# Altium schematic sheet Spider Remote.SchDoc
size A4; SheetNumber: 1; SheetTotal: 1
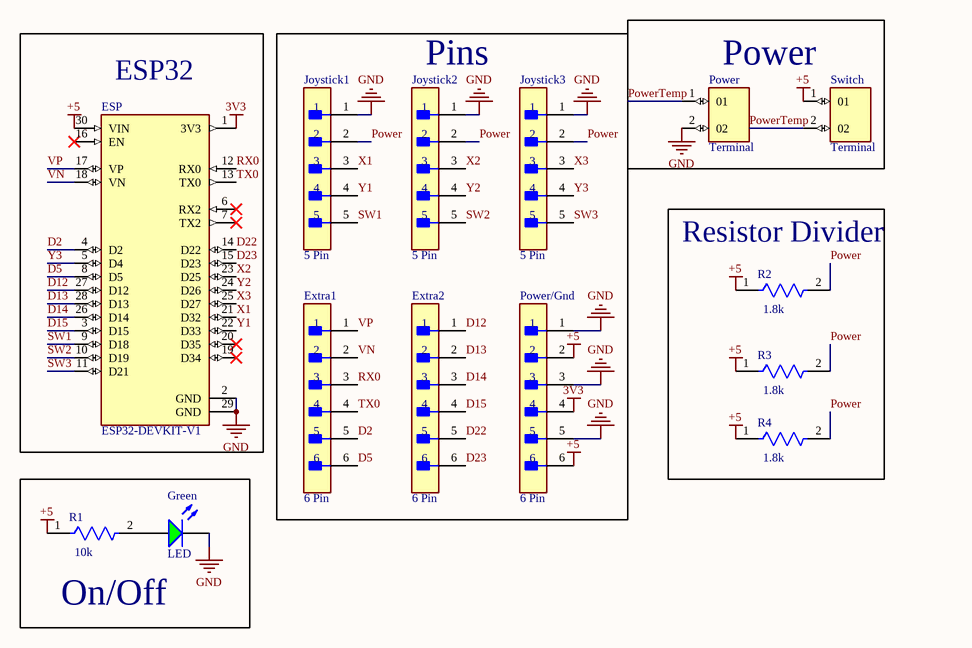
[diagram p0: Spider Remote.SchDoc]

## Parts
ESP  ESP32-DEVKIT-V1  [MODULE_ESP32_DEVKIT_V1]
Extra1  6 Pin  [FP-22-28-4063-MFG]
Extra2  6 Pin  [FP-22-28-4063-MFG]
Green  LED  [KING-WP7113SGD_V]
Joystick1  5 Pin  [FP-90120-0125-MFG]
Joystick2  5 Pin  [FP-90120-0125-MFG]
Joystick3  5 Pin  [FP-90120-0125-MFG]
Power  Terminal  [EBBA-02-C-SS-BU]
Power/Gnd  6 Pin  [FP-22-28-4063-MFG]
R1  10k  [FP-MBB0207-MFG]
R2  1.8k  [FP-MBB0207-MFG]
R3  1.8k  [FP-MBB0207-MFG]
R4  1.8k  [FP-MBB0207-MFG]
Switch  Terminal  [EBBA-02-C-SS-BU]

## Blocks framed on the sheet
ESP32: ESP
Pins: Extra1 Extra2 Joystick1-Joystick3 Power/Gnd
Power: Power Switch
Resistor Divider: R2-R4
On/Off: Green R1

## Nets
3V3: ESP.1(3V3) Power/Gnd.4
+5: ESP.30(VIN) Power/Gnd.2 Power/Gnd.6 R1.1 R2.1 R3.1 R4.1 Switch.1(01)
GND: ESP.2(GND) ESP.29(GND) Green.2(K) Joystick1.1 Joystick2.1 Joystick3.1 Power.2(02) Power/Gnd.1 Power/Gnd.3 Power/Gnd.5
D2: ESP.4(D2) Extra1.5
D5: ESP.8(D5) Extra1.6
D12: ESP.27(D12) Extra2.1
D13: ESP.28(D13) Extra2.2
D14: ESP.26(D14) Extra2.3
D15: ESP.3(D15) Extra2.4
D22: ESP.14(D22) Extra2.5
D23: ESP.15(D23) Extra2.6
Power: Joystick1.2 Joystick2.2 Joystick3.2 R2.2 R3.2 R4.2
PowerTemp: Power.1(01) Switch.2(02)
RX0: ESP.12(RX0) Extra1.3
SW1: ESP.9(D18) Joystick1.5
SW2: ESP.10(D19) Joystick2.5
SW3: ESP.11(D21) Joystick3.5
TX0: ESP.13(TX0) Extra1.4
VN: ESP.18(VN) Extra1.2
VP: ESP.17(VP) Extra1.1
X1: ESP.21(D32) Joystick1.3
X2: ESP.23(D25) Joystick2.3
X3: ESP.25(D27) Joystick3.3
Y1: ESP.22(D33) Joystick1.4
Y2: ESP.24(D26) Joystick2.4
Y3: ESP.5(D4) Joystick3.4
NetGreen_1: Green.1(A) R1.2

Not connected (* = marked no-connect by the designer): ESP 6(RX2)* 7(TX2)* 16(EN)* 19(D34)* 20(D35)*

## Library data of the parts
ESP = CMP-003-000000-1: Dual core, Wi-Fi: 2.4 GHz up to 150 Mbits/s,BLE (Bluetooth Low Energy) and legacy Bluetooth, 32 bits, Up to 240 MHz; MF: Do it; Design Item ID: ESP32-DEVKIT-V1; MP: ESP32-DEVKIT-V1; Check_prices: https://www.snapeda.com/parts/ESP32-DEVKIT-V1/Do+it/view-part/?ref=eda; SnapEDA_Link: https://www.snapeda.com/parts/ESP32-DEVKIT-V1/Do+it/view-part/?ref=snap; Source: ESP32-DEVKIT-V1.SchLib; Pin Count: 30; Value: *; Package: None; Component Type: Standard
Extra1 Extra2 Power/Gnd = CMP-04776-000885-1: CONN HEADER VERT 6POS 2.54MM; Number of Circuits: 6; Voltage Rating (DC): 250V; Connector Type: Male Pin; Contact Resistance: 20mR; Glow Wire Compliant: Non-compliant; Gender: Male; Current Rating: 4A; Max Voltage Rating (DC): 250.25kV; Series: KK® 42375; Termination: Solder; Orientation: Straight; Max Operating Temperature: 75°C; Min Operating Temperature: 0°C; Mount: Through Hole; Depth: 2.49mm; Contact Material: Brass; Number of Positions: 6; Contact Mating Length: 0.24inch; Number of Rows: 1; Housing Color: Black; Max Voltage Rating (AC): 250V; Housing Material: Thermoplastic; Packaging: Bulk; Contact Plating: Gold; Contact Type: Male Pin; Package Quantity: 1; Number of Contacts: 6; Voltage Rating: 250V; Lead Free: Lead Free; RoHS Compliant: Yes; Pitch: 2.54mm; Color: Black; Flammability Rating: UL94 V-0; Radiation Hardening: No
Green = CMP-2100-03698-1: LED Green, 62.5 mW, 25 mA, -40 to 85 degC, 2-Pin THD, RoHS, Bulk; Manufacturer: Kingbright; Viewing Angle: 30degrees; Lens Style: Tinted; Test Current: 20mA; Forward Voltage: 2.2V; Wavelength: 568nm; Luminous Intensity: 40mcd; Package Reference: WP7113SGD; Colour: Green; Lead Free: LeadFree; Packaging: Bulk; RoHSCompliant: true; Package Quantity: 1000; Illumination Colour: Green; Case/Package: Radial; Datasheet URL: http://www.kingbrightusa.com/images/catalog/SPEC/WP7113SGD.pdf; Dominant Wavelength: 568nm; Datasheet Version: Rev. 6B, 01/2015; Package Description: 2-Pin Through Hole Device, Dia 5.9 mm, Body Length 8.6 mm; Height: 8.6mm
Joystick1-Joystick3 = CMP-00257-00655425-1: 90120-0125 2.54mm Pitch C-Grid III Header, Single Row, Vertical, 5 Circuits, Tin (Sn) Plating; NexarPartId: 655425; Manufacturer Lifecycle Status: ACTIVE; Lead Length: 2.9mm; Number of Positions: 5; Current Rating: 3A; Mating Post Length: 6.75mm; Glow Wire Compliant: Non-compliant; Contact Resistance: 20mΩ; Voltage Rating: 350V; Gender: Male; Max Voltage Rating (DC): 350.35kV; Max Operating Temperature: 125°C; Number of Pins: 5; Plating: Tin; Contact Material: Brass; Mount: Through Hole; Contact Gender: Male; Packaging: Bulk; Schedule B: 8536694040; Lifecycle Status: Production; Lead Pitch: 2.54mm; Radiation Hardening: No; Orientation: Vertical; Min Operating Temperature: -55°C; Country of Origin: SK; Housing Color: Black; REACH SVHC: No SVHC; Contact Plating: Tin; Number of Rows: 1; Number of Circuits: 5; Termination: Solder; Number of Contacts: 5; Pitch: 2.54mm; Housing Material: Polyester; RoHS: Compliant; Lead Free: Lead Free; Voltage Rating (AC): 350V
Power Switch = CMP-002-00072-2: Terminal block, EURO BLOCK, slotted screw, 5.00mm pitch, blue, 2 position; MF: Adam Tech; Check_prices: https://www.snapeda.com/parts/EBBA-02-C-SS-BU/Adam+Tech/view-part/?ref=eda; Design Item ID: EBBA-02-C-SS-BU; Case/Package: None; Source: EBBA-02-C-SS-BU.SchLib; MP: EBBA-02-C-SS-BU; SnapEDA_Link: https://www.snapeda.com/parts/EBBA-02-C-SS-BU/Adam+Tech/view-part/?ref=snap; Value: *; Component Type: Standard; Pins: 2
R1-R4 = CMP-02408-000035-1: RES 10K OHM 0.6W 1% AXIAL; Voltage Rating: 300V; Resistance: 10kR; Max Power Dissipation: 600mW; Temperature Coefficient: 50ppm/°C; Radiation Hardening: No; Case/Package: Conformal; Termination: Axial; Military Standard: Not; Length: 6.5mm; Voltage Rating (DC): 300V; RoHS Compliant: Yes; Number of Terminations: 2; Packaging: Tape and Reel; Features: Automotive AEC-Q200; Tolerance: 1%; Min Operating Temperature: -55°C; Power Rating: 600mW; Lead Free: Lead Free; Resistor Type: Metal Film; Construction: Cylindrical; Series: MBB 0207 - Professional; Max Operating Temperature: 155°C; Diameter: 2.5mm; Resistance Tolerance: 1%; Contact Plating: Tin; Technology: THIN FILM